# Altium project pad-pcb.PrjPcb
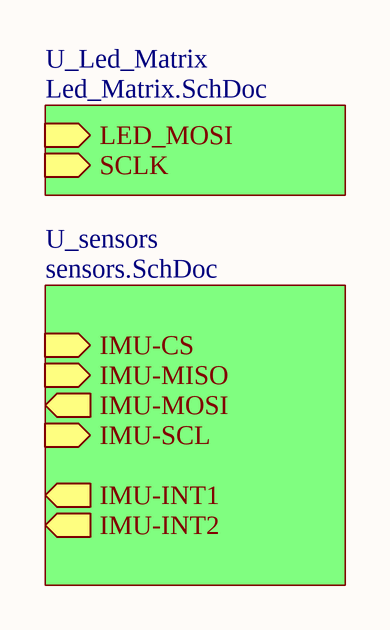
[diagram p0: Main.SchDoc]
3 sheets, 15 parts. Net scope: hierarchical (ports join the sheet entries above them; power ports are global).
Sheets:
  Main.SchDoc
    U_sensors = sensors.SchDoc
    U_Led_Matrix = Led_Matrix.SchDoc

## Sheet Main.SchDoc
size A4; SheetNumber: 1; SheetTotal: 3

### Sub-sheets
U_Led_Matrix = Led_Matrix.SchDoc: LED_MOSI (in), SCLK (in)
U_sensors = sensors.SchDoc: IMU-INT2 (out), IMU-INT1 (out), IMU-SCL (in), IMU-MOSI (out), IMU-MISO (in), IMU-CS (in)

## Sheet sensors.SchDoc
size A4; SheetNumber: 2; SheetTotal: 2
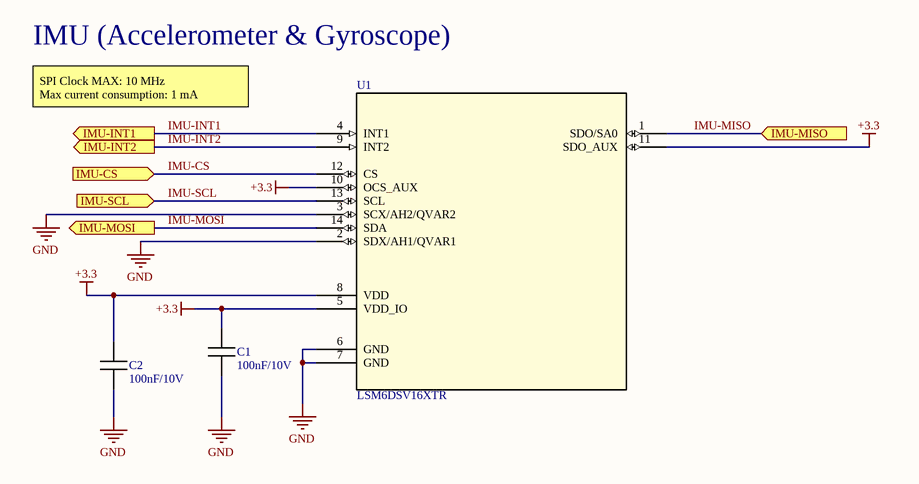
[diagram p1: sensors.SchDoc]

### Parts
C1  value 100nF/10V  [Capacitor_0805]  (hidden comment: Capacitor)
C2  value 100nF/10V  [Capacitor_0805]  (hidden comment: Capacitor)
U1  LSM6DSV16XTR  [LGA-14L_STM]

### Ports
IMU-CS (in, see Main[3C]), IMU-INT1 (out, see Main[3C]), IMU-INT2 (out, see Main[3C]), IMU-MISO (in, see Main[3C]), IMU-MOSI (out, see Main[3C]), IMU-SCL (in, see Main[3C])

### Nets
+3.3: C1.1 C2.1 U1.5(VDD_IO) U1.8(VDD) U1.10(OCS_AUX) U1.11(SDO_AUX)
GND: C1.0 C2.0 U1.2(SDX/AH1/QVAR1) U1.3(SCX/AH2/QVAR2) U1.6(GND) U1.7(GND)
IMU-CS: U1.12(CS) ; port IMU-CS
IMU-INT1: U1.4(INT1) ; port IMU-INT1
IMU-INT2: U1.9(INT2) ; port IMU-INT2
IMU-MISO: U1.1(SDO/SA0) ; port IMU-MISO
IMU-MOSI: U1.14(SDA) ; port IMU-MOSI
IMU-SCL: U1.13(SCL) ; port IMU-SCL

### Notes on the sheet
- IMU (Accelerometer & Gyroscope)
- SPI Clock MAX: 10 MHz
  Max current consumption: 1 mA

### Library data of the parts
C1 C2 = d5545c32-35b3-4590-a9f7-320b11ab5976: Part Number: Capacitor SMD 0805 100nF/10V; UUID: d5545c32-35b3-4590-a9f7-320b11ab5976; Availability: 0
U1 = 42eb7ce3-c8ef-4d56-9a68-980b0afe7d6a: 6-axis inertial measurement unit (IMU) with embedded AI and sensor fusion, Qvar for high-end applications; Manufacturer_Name: STMicroelectronics; Tags: imu, project_joycons; Copyright: Copyright (C) 2025 Ultra Librarian. All rights reserved.; Manufacturer_Part_Number: LSM6DSV16XTR; RefDes: RefDes; Type: Type; UUID: 42eb7ce3-c8ef-4d56-9a68-980b0afe7d6a; Part Number: LSM6DSV16XTR; Manufacturer: STMicroelectronics; Availability: 0; Supplier (Mouser): 511-LSM6DSV16XTR; Supplier (LCSC Electronics): C5267406

## Sheet Led_Matrix.SchDoc
size A4; SheetNumber: 3; SheetTotal: 3
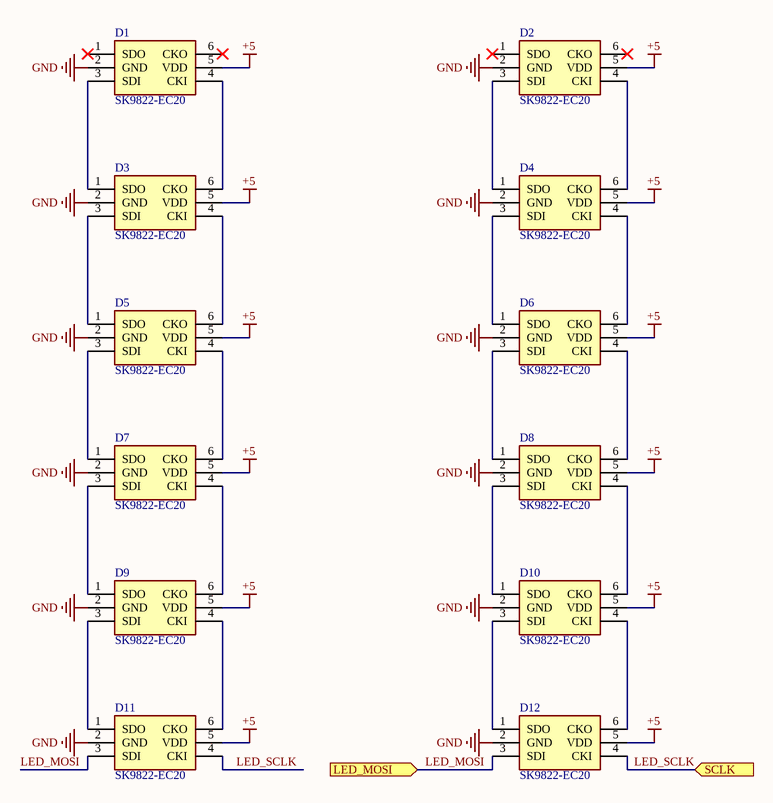
[diagram p2: Led_Matrix.SchDoc]

### Parts
D1  SK9822-EC20  [SK9822EC20]
D2  SK9822-EC20  [SK9822EC20]
D3  SK9822-EC20  [SK9822EC20]
D4  SK9822-EC20  [SK9822EC20]
D5  SK9822-EC20  [SK9822EC20]
D6  SK9822-EC20  [SK9822EC20]
D7  SK9822-EC20  [SK9822EC20]
D8  SK9822-EC20  [SK9822EC20]
D9  SK9822-EC20  [SK9822EC20]
D10  SK9822-EC20  [SK9822EC20]
D11  SK9822-EC20  [SK9822EC20]
D12  SK9822-EC20  [SK9822EC20]

### Ports
LED_MOSI (in), SCLK (in, see Main[3B])

### Nets
+5: D1.5(VDD) D2.5(VDD) D3.5(VDD) D4.5(VDD) D5.5(VDD) D6.5(VDD) D7.5(VDD) D8.5(VDD) D9.5(VDD) D10.5(VDD) D11.5(VDD) D12.5(VDD)
GND: D1.2(GND) D2.2(GND) D3.2(GND) D4.2(GND) D5.2(GND) D6.2(GND) D7.2(GND) D8.2(GND) D9.2(GND) D10.2(GND) D11.2(GND) D12.2(GND)
LED_MOSI: D11.3(SDI) D12.3(SDI) ; port LED_MOSI
LED_SCLK: D11.4(CKI) D12.4(CKI) ; port SCLK
NetD1_3: D1.3(SDI) D3.1(SDO)
NetD1_4: D1.4(CKI) D3.6(CKO)
NetD2_3: D2.3(SDI) D4.1(SDO)
NetD2_4: D2.4(CKI) D4.6(CKO)
NetD3_3: D3.3(SDI) D5.1(SDO)
NetD3_4: D3.4(CKI) D5.6(CKO)
NetD4_3: D4.3(SDI) D6.1(SDO)
NetD4_4: D4.4(CKI) D6.6(CKO)
NetD5_3: D5.3(SDI) D7.1(SDO)
NetD5_4: D5.4(CKI) D7.6(CKO)
NetD6_3: D6.3(SDI) D8.1(SDO)
NetD6_4: D6.4(CKI) D8.6(CKO)
NetD7_3: D7.3(SDI) D9.1(SDO)
NetD7_4: D7.4(CKI) D9.6(CKO)
NetD8_3: D8.3(SDI) D10.1(SDO)
NetD8_4: D8.4(CKI) D10.6(CKO)
NetD9_3: D9.3(SDI) D11.1(SDO)
NetD9_4: D9.4(CKI) D11.6(CKO)
NetD10_3: D10.3(SDI) D12.1(SDO)
NetD10_4: D10.4(CKI) D12.6(CKO)

Not connected (* = marked no-connect by the designer): D1 1(SDO)* 6(CKO)*; D2 1(SDO)* 6(CKO)*

### Library data of the parts
D1-D12 = 2b18800c-a704-403f-ba93-8ff8516dbc7d: 40~+80 RGB SMD,2x2mm  Light Emitting Diodes (LED) ROHS; Manufacturer_Name: DONGGUAN OPSCO OPTOELECTRONICS CO., LTD; Manufacturer: OPSCO Optoelectronics; Geometry.Height: 0.75mm; Description: Miniaturowa, adresowalna dioda LED RGB w obudowie SMD 2020 (2,0 × 2,0 mm) ze zintegrowanym układem sterującym, przeznaczona do pracy w matrycach i gęstych aplikacjach oświetleniowych.; Tags: rgb, diod; Manufacturer_Part_Number: SK9822-EC20; Mouser Part Number: *; Mouser Price/Stock: *; Arrow Part Number: *; Arrow Price/Stock: *; Datasheet Link: https://datasheet.lcsc.com/lcsc/2110250930_OPSCO-Optoelectronics-SK9822-EC20_C2909059.pdf; UUID: 2b18800c-a704-403f-ba93-8ff8516dbc7d; Part Number: SK9822-EC20; Availability: 114,004; Supplier (LCSC Electronics): C2909059

## Nets that join several sheets
GND: sensors (6 pins), Led_Matrix (12 pins)